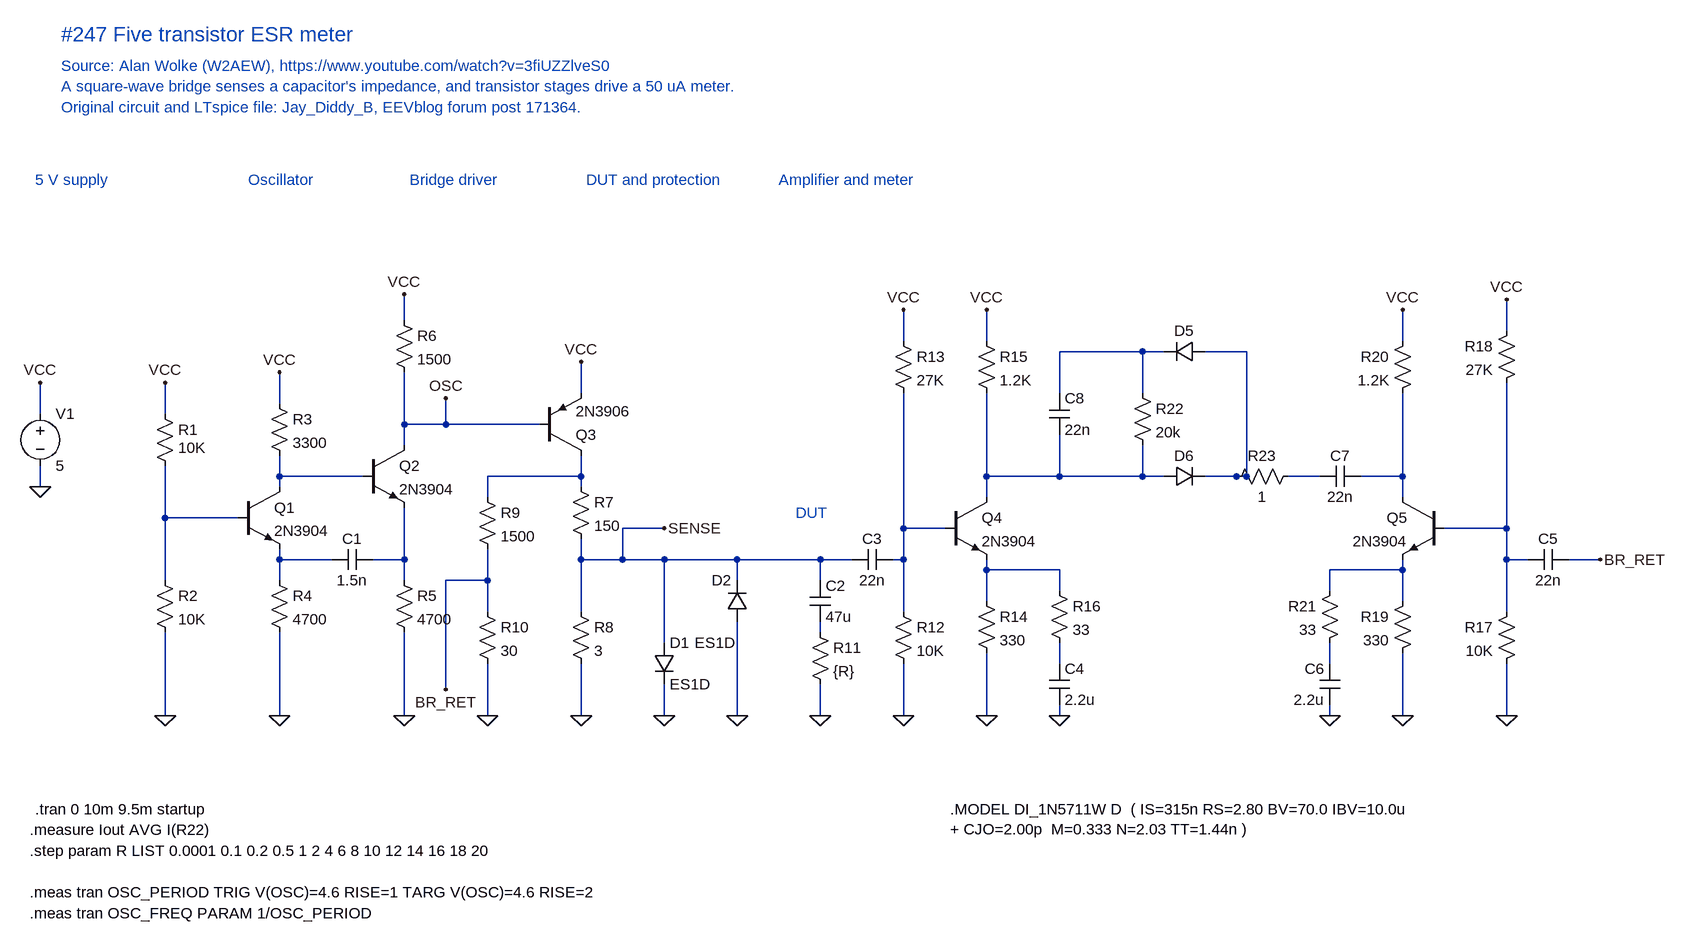
[diagram p0: schematic Five transistor ESR meter.asc]
Five transistor ESR meter.asc, the LTspice schematic file:
Version 4
SHEET 1 2600 1450
WIRE 608 440 608 400
WIRE 2304 456 2304 408
WIRE 1376 472 1376 424
WIRE 1504 472 1504 424
WIRE 2144 472 2144 424
WIRE 1744 488 1616 488
WIRE 1776 488 1744 488
WIRE 1904 488 1840 488
WIRE 880 552 880 504
WIRE 1616 552 1616 488
WIRE 1744 552 1744 488
WIRE 416 568 416 520
WIRE 48 584 48 536
WIRE 240 584 240 536
WIRE 608 600 608 520
WIRE 816 600 608 600
WIRE 672 560 672 600
WIRE 608 632 608 600
WIRE 416 680 416 648
WIRE 544 680 416 680
WIRE 880 680 880 648
WIRE 880 680 736 680
WIRE 1504 680 1504 552
WIRE 1616 680 1616 616
WIRE 1616 680 1504 680
WIRE 1744 680 1744 632
WIRE 1744 680 1616 680
WIRE 1776 680 1744 680
WIRE 1904 680 1904 488
WIRE 1904 680 1840 680
WIRE 1888 680 1904 680
WIRE 2016 680 1968 680
WIRE 2144 680 2144 552
WIRE 2144 680 2080 680
WIRE 48 696 48 664
WIRE 416 696 416 680
WIRE 880 696 880 680
WIRE 736 712 736 680
WIRE 1504 712 1504 680
WIRE 2144 712 2144 680
WIRE 240 744 240 664
WIRE 352 744 240 744
WIRE 1376 760 1376 552
WIRE 1440 760 1376 760
WIRE 2304 760 2304 536
WIRE 2304 760 2208 760
WIRE 416 808 416 792
WIRE 496 808 416 808
WIRE 608 808 608 728
WIRE 608 808 560 808
WIRE 880 808 880 776
WIRE 1008 808 880 808
WIRE 944 760 944 808
WIRE 1008 760 944 760
WIRE 1120 808 1008 808
WIRE 1248 808 1120 808
WIRE 1296 808 1248 808
WIRE 1376 808 1376 760
WIRE 1376 808 1360 808
WIRE 2304 808 2304 760
WIRE 2336 808 2304 808
WIRE 2448 808 2400 808
WIRE 1504 824 1504 808
WIRE 1616 824 1504 824
WIRE 2144 824 2144 808
WIRE 2144 824 2032 824
WIRE 240 840 240 744
WIRE 416 840 416 808
WIRE 608 840 608 808
WIRE 736 840 736 792
WIRE 736 840 672 840
WIRE 672 1008 672 840
WIRE 1120 840 1120 808
WIRE 1248 840 1248 808
WIRE 1616 856 1616 824
WIRE 2032 856 2032 824
WIRE 1504 872 1504 824
WIRE 2144 872 2144 824
WIRE 736 888 736 840
WIRE 880 888 880 808
WIRE 1376 888 1376 808
WIRE 2304 888 2304 808
WIRE 1248 920 1248 904
WIRE 1008 936 1008 808
WIRE 1616 968 1616 936
WIRE 2032 968 2032 936
WIRE 240 1048 240 920
WIRE 416 1048 416 920
WIRE 608 1048 608 920
WIRE 736 1048 736 968
WIRE 880 1048 880 968
WIRE 1008 1048 1008 1000
WIRE 1120 1048 1120 904
WIRE 1248 1048 1248 1000
WIRE 1376 1048 1376 968
WIRE 1504 1048 1504 952
WIRE 1616 1048 1616 1032
WIRE 2032 1048 2032 1032
WIRE 2144 1048 2144 952
WIRE 2304 1048 2304 968
FLAG 240 1048 0
FLAG 48 696 0
FLAG 416 1048 0
FLAG 608 1048 0
FLAG 880 1048 0
FLAG 736 1048 0
FLAG 1120 1048 0
FLAG 1008 1048 0
FLAG 1248 1048 0
FLAG 1376 1048 0
FLAG 1504 1048 0
FLAG 1616 1048 0
FLAG 2304 1048 0
FLAG 2144 1048 0
FLAG 2032 1048 0
FLAG 48 536 VCC
FLAG 240 536 VCC
FLAG 416 520 VCC
FLAG 608 400 VCC
FLAG 880 504 VCC
FLAG 1376 424 VCC
FLAG 1504 424 VCC
FLAG 2144 424 VCC
FLAG 2304 408 VCC
FLAG 672 1008 BR_RET
FLAG 672 560 OSC
FLAG 1008 760 SENSE
FLAG 2448 808 BR_RET
SYMBOL res 224 568 R0
WINDOW 3 36 68 Left 2
SYMATTR Value 10K
SYMATTR InstName R1
SYMBOL res 224 824 R0
SYMATTR InstName R2
SYMATTR Value 10K
SYMBOL voltage 48 568 R0
WINDOW 123 0 0 Left 2
WINDOW 39 0 0 Left 2
SYMATTR InstName V1
SYMATTR Value 5
SYMBOL res 400 552 R0
SYMATTR InstName R3
SYMATTR Value 3300
SYMBOL res 400 824 R0
SYMATTR InstName R4
SYMATTR Value 4700
SYMBOL res 592 824 R0
SYMATTR InstName R5
SYMATTR Value 4700
SYMBOL npn 352 696 R0
SYMATTR InstName Q1
SYMATTR Value 2N3904
SYMBOL cap 560 792 R90
WINDOW 0 0 32 VBottom 2
WINDOW 3 32 32 VTop 2
SYMATTR InstName C1
SYMATTR Value 1.5n
SYMBOL npn 544 632 R0
SYMATTR InstName Q2
SYMATTR Value 2N3904
SYMBOL res 592 424 R0
SYMATTR InstName R6
SYMATTR Value 1500
SYMBOL pnp 816 648 M180
SYMATTR InstName Q3
SYMATTR Value 2N3906
SYMBOL res 864 680 R0
SYMATTR InstName R7
SYMATTR Value 150
SYMBOL res 864 872 R0
SYMATTR InstName R8
SYMATTR Value 3
SYMBOL res 720 696 R0
SYMATTR InstName R9
SYMATTR Value 1500
SYMBOL res 720 872 R0
SYMATTR InstName R10
SYMATTR Value 30
SYMBOL diode 992 936 R0
SYMATTR InstName D1
SYMATTR Value ES1D
SYMBOL diode 1136 904 R180
WINDOW 0 24 64 Left 2
WINDOW 3 19 -32 Left 2
SYMATTR InstName D2
SYMATTR Value ES1D
SYMBOL cap 1232 840 R0
SYMATTR InstName C2
SYMATTR Value 47u
SYMBOL res 1232 904 R0
SYMATTR InstName R11
SYMATTR Value {R}
SYMBOL cap 1360 792 R90
WINDOW 0 0 32 VBottom 2
WINDOW 3 32 32 VTop 2
SYMATTR InstName C3
SYMATTR Value 22n
SYMBOL res 1360 872 R0
SYMATTR InstName R12
SYMATTR Value 10K
SYMBOL res 1360 456 R0
SYMATTR InstName R13
SYMATTR Value 27K
SYMBOL npn 1440 712 R0
SYMATTR InstName Q4
SYMATTR Value 2N3904
SYMBOL res 1488 856 R0
SYMATTR InstName R14
SYMATTR Value 330
SYMBOL res 1488 456 R0
SYMATTR InstName R15
SYMATTR Value 1.2K
SYMBOL res 1600 840 R0
SYMATTR InstName R16
SYMATTR Value 33
SYMBOL cap 1600 968 R0
SYMATTR InstName C4
SYMATTR Value 2.2u
SYMBOL cap 2336 792 M90
WINDOW 0 0 32 VBottom 2
WINDOW 3 32 32 VTop 2
SYMATTR InstName C5
SYMATTR Value 22n
SYMBOL res 2320 872 M0
SYMATTR InstName R17
SYMATTR Value 10K
SYMBOL res 2320 440 M0
SYMATTR InstName R18
SYMATTR Value 27K
SYMBOL npn 2208 712 M0
SYMATTR InstName Q5
SYMATTR Value 2N3904
SYMBOL res 2160 856 M0
SYMATTR InstName R19
SYMATTR Value 330
SYMBOL res 2160 456 M0
SYMATTR InstName R20
SYMATTR Value 1.2K
SYMBOL res 2048 840 M0
SYMATTR InstName R21
SYMATTR Value 33
SYMBOL cap 2048 968 M0
SYMATTR InstName C6
SYMATTR Value 2.2u
SYMBOL diode 1840 472 R90
WINDOW 0 0 32 VBottom 2
WINDOW 3 0 0 Invisible 2
SYMATTR InstName D5
SYMATTR Value DI_1N5711W
SYMBOL diode 1776 696 R270
WINDOW 0 32 32 VTop 2
WINDOW 3 0 0 Invisible 2
SYMATTR InstName D6
SYMATTR Value DI_1N5711W
SYMBOL cap 2080 664 R90
WINDOW 0 0 32 VBottom 2
WINDOW 3 32 32 VTop 2
SYMATTR InstName C7
SYMATTR Value 22n
SYMBOL res 1728 536 R0
SYMATTR InstName R22
SYMATTR Value 20k
SYMBOL cap 1600 552 R0
SYMATTR InstName C8
SYMATTR Value 22n
SYMBOL res 1984 664 R90
WINDOW 0 0 56 VBottom 2
WINDOW 3 32 56 VTop 2
SYMATTR InstName R23
SYMATTR Value 1
TEXT 40 1192 Left 2 !.tran 0 10m 9.5m startup
TEXT 32 1320 Left 2 !.meas tran OSC_PERIOD TRIG V(OSC)=4.6 RISE=1 TARG V(OSC)=4.6 RISE=2
TEXT 32 1352 Left 2 !.meas tran OSC_FREQ PARAM 1/OSC_PERIOD
TEXT 32 1256 Left 2 !.step param R LIST 0.0001 0.1 0.2 0.5 1 2 4 6 8 10 12 14 16 18 20
TEXT 32 1224 Left 2 !.measure Iout AVG I(R22)
TEXT 1448 1192 Left 2 !.MODEL DI_1N5711W D  ( IS=315n RS=2.80 BV=70.0 IBV=10.0u\n+ CJO=2.00p  M=0.333 N=2.03 TT=1.44n )
TEXT 40 224 Left 2 ;5 V supply
TEXT 368 224 Left 2 ;Oscillator
TEXT 616 224 Left 2 ;Bridge driver
TEXT 888 224 Left 2 ;DUT and protection
TEXT 1184 224 Left 2 ;Amplifier and meter
TEXT 1210 736 Left 2 ;DUT
TEXT 80 0 Left 3 ;#247 Five transistor ESR meter
TEXT 80 48 Left 2 ;Source: Alan Wolke (W2AEW), https://www.youtube.com/watch?v=3fiUZZlveS0
TEXT 80 80 Left 2 ;A square-wave bridge senses a capacitor's impedance, and transistor stages drive a 50 uA meter.
TEXT 80 112 Left 2 ;Original circuit and LTspice file: Jay_Diddy_B, EEVblog forum post 171364.

The netlist it stands for:
* Five transistor ESR meter.asc
R1 VCC N008 10K
R2 N008 0 10K
V1 VCC 0 5
R3 VCC N003 3300
R4 N011 0 4700
R5 N012 0 4700
Q1 N003 N008 N011 0 2N3904
C1 N012 N011 1.5n
Q2 OSC N003 N012 0 2N3904
R6 VCC OSC 1500
Q3 N004 OSC VCC 0 2N3906
R7 N004 SENSE 150
R8 SENSE 0 3
R9 N004 BR_RET 1500
R10 BR_RET 0 30
D1 SENSE 0 ES1D
D2 0 SENSE ES1D
C2 SENSE N015 47u
R11 N015 0 {R}
C3 N009 SENSE 22n
R12 N009 0 10K
R13 VCC N009 27K
Q4 N005 N009 N013 0 2N3904
R14 N013 0 330
R15 VCC N005 1.2K
R16 N013 N016 33
C4 N016 0 2.2u
C5 N010 BR_RET 22n
R17 N010 0 10K
R18 VCC N010 27K
Q5 N007 N010 N014 0 2N3904
R19 N014 0 330
R20 VCC N007 1.2K
R21 N014 N017 33
C6 N017 0 2.2u
D5 N002 N001 DI_1N5711W
D6 N005 N002 DI_1N5711W
C7 N007 N006 22n
R22 N001 N005 20k
C8 N001 N005 22n
R23 N006 N002 1
.model D D
.lib standard.dio
.model NPN NPN
.model PNP PNP
.lib standard.bjt
.tran 0 10m 9.5m startup
.meas tran OSC_PERIOD TRIG V(OSC)=4.6 RISE=1 TARG V(OSC)=4.6 RISE=2
.meas tran OSC_FREQ PARAM 1/OSC_PERIOD
.step param R LIST 0.0001 0.1 0.2 0.5 1 2 4 6 8 10 12 14 16 18 20
.measure Iout AVG I(R22)
.MODEL DI_1N5711W D  ( IS=315n RS=2.80 BV=70.0 IBV=10.0u
+ CJO=2.00p  M=0.333 N=2.03 TT=1.44n )
* 5 V supply
* Oscillator
* Bridge driver
* DUT and protection
* Amplifier and meter
* DUT
* #247 Five transistor ESR meter
* Source: Alan Wolke (W2AEW), https://www.youtube.com/watch?v=3fiUZZlveS0
* A square-wave bridge senses a capacitor's impedance, and transistor stages drive a 50 uA meter.
* Original circuit and LTspice file: Jay_Diddy_B, EEVblog forum post 171364.
.backanno
.end